# EAGLE schematic Schematic (EAGLE 9.7.0)
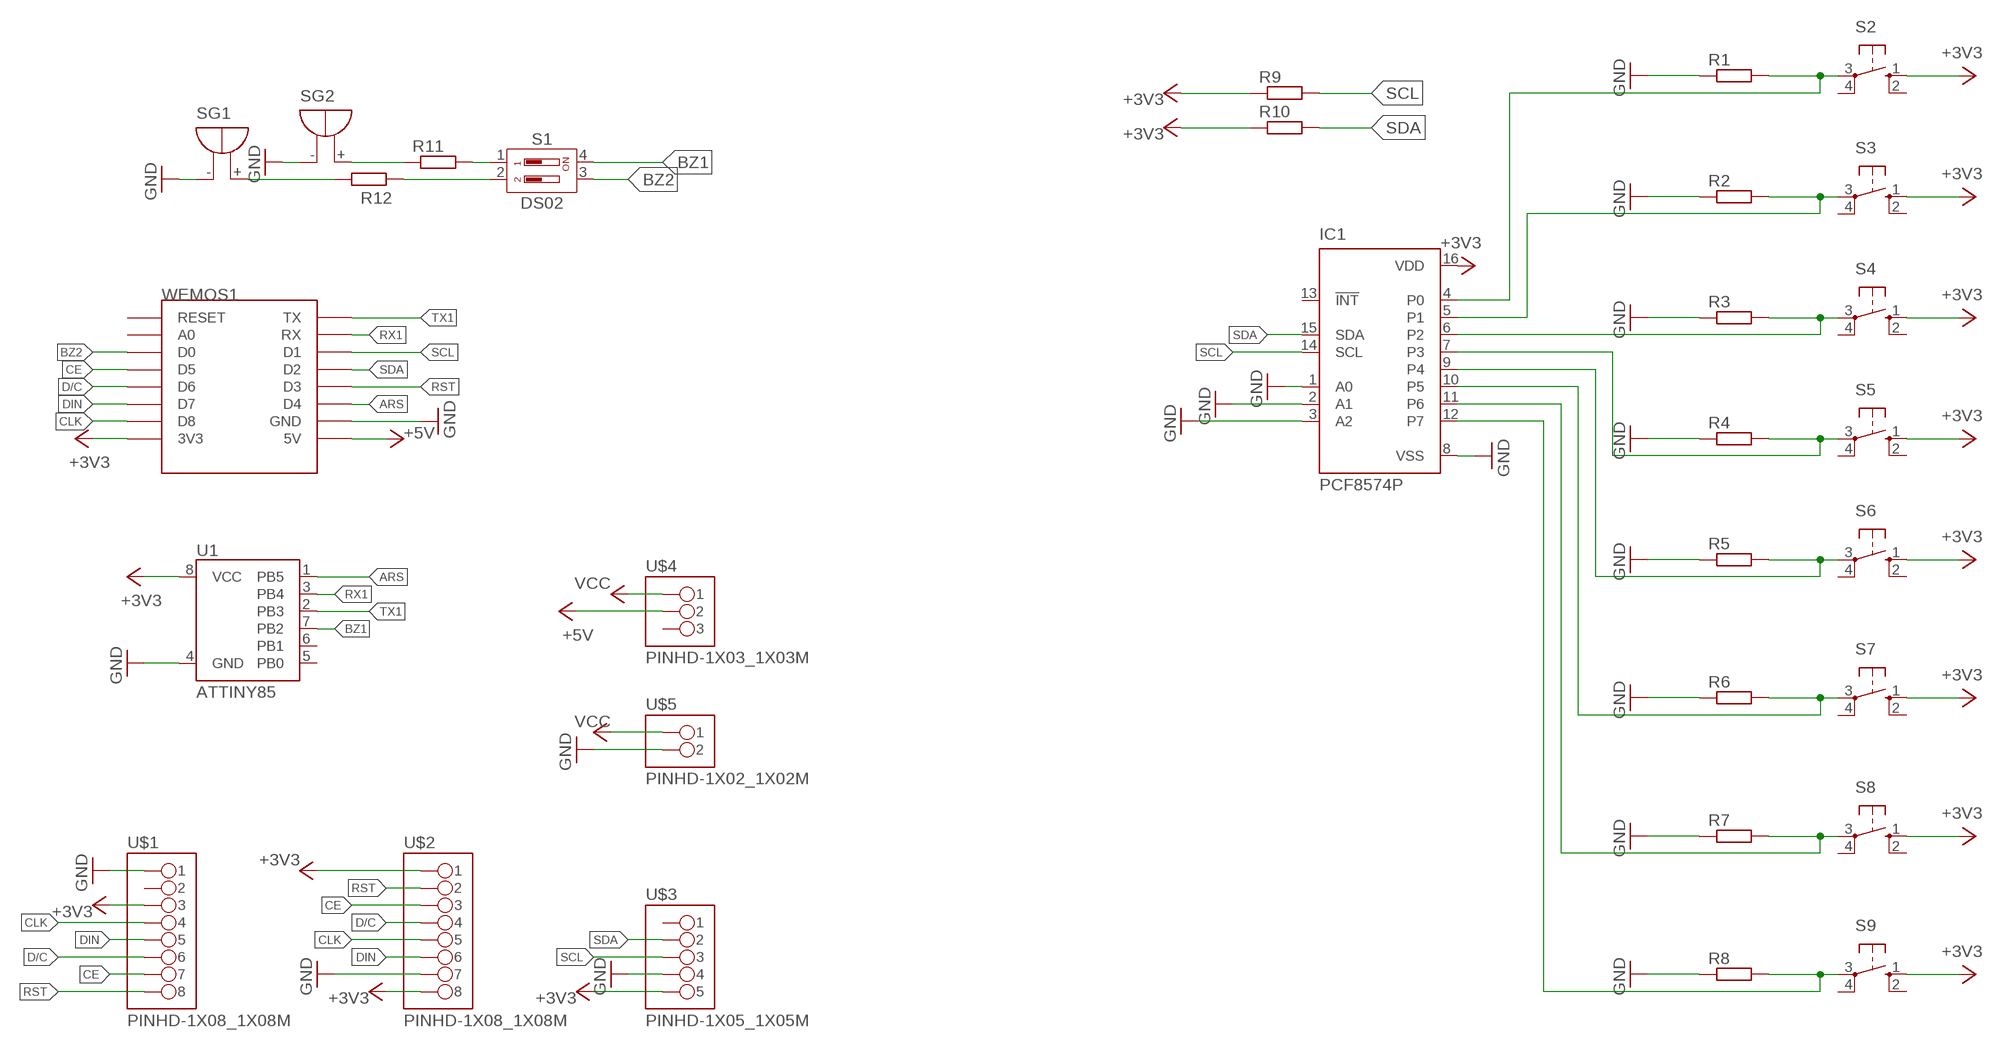
[diagram p0: schematic, sheet 1]

## Parts
IC1  PCF8574P  [DIL16]
R1  R-EU_0207/10  [0207/10]
R2  R-EU_0207/10  [0207/10]
R3  R-EU_0207/10  [0207/10]
R4  R-EU_0207/10  [0207/10]
R5  R-EU_0207/10  [0207/10]
R6  R-EU_0207/10  [0207/10]
R7  R-EU_0207/10  [0207/10]
R8  R-EU_0207/10  [0207/10]
R9  R-EU_0207/10  [0207/10]
R10  R-EU_0207/10  [0207/10]
R11  R-EU_0207/10  [0207/10]
R12  R-EU_0207/10  [0207/10]
S1  DS02  [DS-02]
S2  10-XX  [B3F-10XX]
S3  10-XX  [B3F-10XX]
S4  10-XX  [B3F-10XX]
S5  10-XX  [B3F-10XX]
S6  10-XX  [B3F-10XX]
S7  10-XX  [B3F-10XX]
S8  10-XX  [B3F-10XX]
S9  10-XX  [B3F-10XX]
SG1  F/QMBIII  [F/QMBIII]
SG2  F/QMBIII  [F/QMBIII]
U1  ATTINY85  [ATTINY85]
U$1  PINHD-1X08_1X08M  [1X08]
U$2  PINHD-1X08_1X08M  [1X08]
U$3  PINHD-1X05_1X05M  [1X05]
U$4  PINHD-1X03_1X03M  [1X03]
U$5  PINHD-1X02_1X02M  [1X02]
WEMOS1  WEMOS-D1-MINI  [WEMOS-D1-MINI]

## Nets
+3V3: IC1.16(VDD) R9.1 R10.1 S2.1(S) S3.1(S) S4.1(S) S5.1(S) S6.1(S) S7.1(S) S8.1(S) S9.1(S) U1.8(VCC) U$1.3 U$2.1 U$2.8 U$3.5 WEMOS1.3V3
+5V: U$4.2 WEMOS1.5V
ARS: U1.1(PB5) WEMOS1.D4
BZ1: S1.4 U1.7(PB2)
BZ2: S1.3 WEMOS1.D0
CE: U$1.7 U$2.3 WEMOS1.D5
CLK: U$1.4 U$2.5 WEMOS1.D8
D/C: U$1.6 U$2.4 WEMOS1.D6
DIN: U$1.5 U$2.6 WEMOS1.D7
GND: IC1.1(A0) IC1.2(A1) IC1.3(A2) IC1.8(VSS) R1.1 R2.1 R3.1 R4.1 R5.1 R6.1 R7.1 R8.1 SG1.-(+) SG2.-(+) U1.4(GND) U$1.1 U$2.7 U$3.4 U$5.2 WEMOS1.GND
N$1: R11.2 S1.1
N$2: R12.2 S1.2
N$3: R11.1 SG2.+(-)
N$4: R12.1 SG1.+(-)
N$5: IC1.4(P0) R1.2 S2.3(P)
N$7: IC1.5(P1) R2.2 S3.3(P)
N$9: IC1.6(P2) R3.2 S4.3(P)
N$11: IC1.7(P3) R4.2 S5.3(P)
N$13: IC1.9(P4) R5.2 S6.3(P)
N$15: IC1.10(P5) R6.2 S7.3(P)
N$17: IC1.11(P6) R7.2 S8.3(P)
N$19: IC1.12(P7) R8.2 S9.3(P)
RST: U$1.8 U$2.2 WEMOS1.D3
RX1: U1.3(PB4) WEMOS1.RX
SCL: IC1.14(SCL) R9.2 U$3.3 WEMOS1.D1
SDA: IC1.15(SDA) R10.2 U$3.2 WEMOS1.D2
TX1: U1.2(PB3) WEMOS1.TX
VCC: U$4.1 U$5.1
Unconnected: IC1.13(!INT) S2.2(S1) S2.4(P1) S3.2(S1) S3.4(P1) S4.2(S1) S4.4(P1) S5.2(S1) S5.4(P1) S6.2(S1) S6.4(P1) S7.2(S1) S7.4(P1) S8.2(S1) S8.4(P1) S9.2(S1) S9.4(P1) U1.5(PB0) U1.6(PB1) U$1.2 U$3.1 U$4.3 WEMOS1.A0 WEMOS1.RESET

## Library data of the parts
IC1 = micro-philips:PCF8574: I2C-Bus Remote 8-bit I/O expander http://www.semiconductors.philips.com/acrobat_download/datasheets/PCF8574_4.pdf; MPN: PCF8574PN; OC_FARNELL: 204020; OC_NEWARK: 11N8515
R1-R12 = rcl:R-EU_: RESISTOR, European symbol; SPICEPREFIX: R
S1 = Switch:DS02: DIL/CODE Switch; CATEGORY_L1: Switches; CATEGORY_L2: DIP Switches; CATEGORY_L3: SPST-NO; DATASHEET: https://www.farnell.com/datasheets/2925626.pdf; DESCRIPTION: DIP Switch Slide Type 2Pos SPST-NO Raised Actuator Red TH; MANUFACTURER: Multicomp Pro; MPN: MCNDS-02V; OPERATING_TEMPERATURE: -40°C ~ 85°C; PACKAGE: Through Hole; PACKAGE_SIZE: NA; PART_STATUS: Obsolete; ROHS: Compliant
S2-S9 = switch-omron:10-XX: OMRON SWITCH; MPN: B3F-1000; OC_FARNELL: 176432; OC_NEWARK: 36M3542
SG1 SG2 = buzzer:F/QMBIII: BUZZER Source: Buerklin; OC_FARNELL: unknown; OC_NEWARK: unknown
U1 = SparkFun-IC-Microcontroller:ATTINY85; PROD_ID: IC-09092
U$1 U$2 = Tinkercad:PINHD-1X08
U$3 = Tinkercad:PINHD-1X05
U$4 = Tinkercad:PINHD-1X03
U$5 = Tinkercad:PINHD-1X02
WEMOS1 = esp8266modules:WEMOS-D1-MINI: WeMos.cc D1 mini ESP8266 module